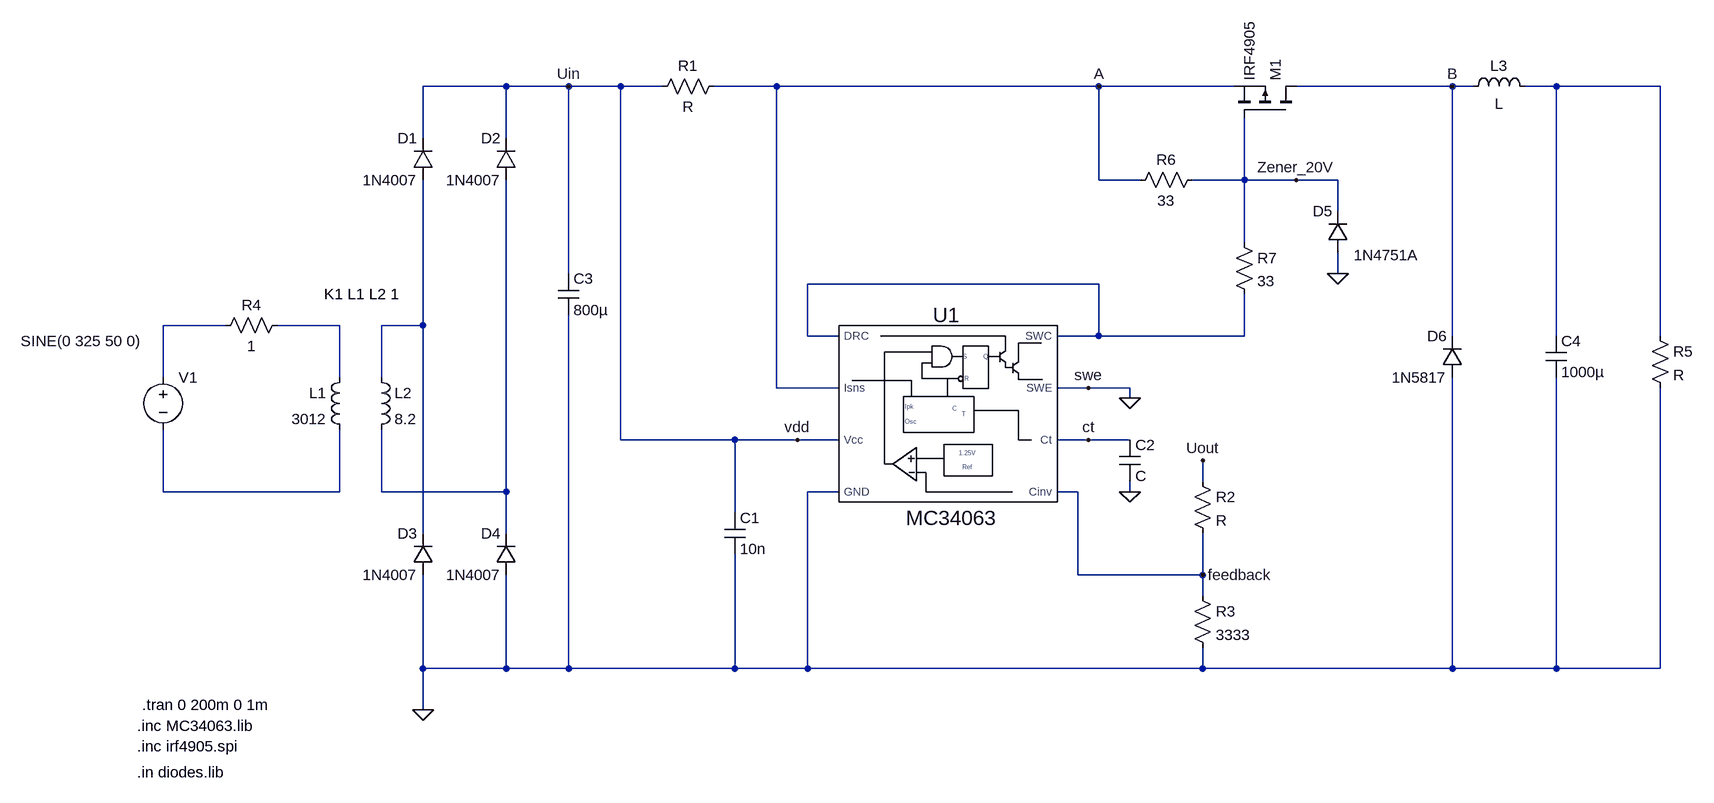
[diagram p0: schematic StepDown_Student.asc]
StepDown_Student.asc, the LTspice schematic file:
Version 4.1
SHEET 1 6568 1292
WIRE -448 -368 -576 -368
WIRE -352 -368 -448 -368
WIRE -272 -368 -352 -368
WIRE -208 -368 -272 -368
WIRE -32 -368 -128 -368
WIRE 464 -368 -32 -368
WIRE 672 -368 464 -368
WIRE 1008 -368 768 -368
WIRE 1040 -368 1008 -368
WIRE 1168 -368 1120 -368
WIRE 1328 -368 1168 -368
WIRE -576 -288 -576 -368
WIRE -448 -288 -448 -368
WIRE 464 -224 464 -368
WIRE 528 -224 464 -224
WIRE 688 -224 688 -320
WIRE 688 -224 608 -224
WIRE 768 -224 688 -224
WIRE 832 -224 768 -224
WIRE 832 -176 832 -224
WIRE 688 -128 688 -224
WIRE -352 -80 -352 -368
WIRE 832 -80 832 -112
WIRE 464 -64 16 -64
WIRE -880 0 -976 0
WIRE -704 0 -800 0
WIRE -576 0 -576 -224
WIRE -576 0 -640 0
WIRE 16 16 16 -64
WIRE 64 16 16 16
WIRE 464 16 464 -64
WIRE 464 16 400 16
WIRE 688 16 688 -48
WIRE 688 16 464 16
WIRE 1008 16 1008 -368
WIRE 1168 16 1168 -368
WIRE 1328 16 1328 -368
WIRE -976 80 -976 0
WIRE -704 80 -704 0
WIRE -640 80 -640 0
WIRE -32 96 -32 -368
WIRE 64 96 -32 96
WIRE 448 96 400 96
WIRE 512 96 448 96
WIRE 512 112 512 96
WIRE -272 176 -272 -368
WIRE -96 176 -272 176
WIRE 0 176 -96 176
WIRE 64 176 0 176
WIRE 448 176 400 176
WIRE 512 176 448 176
WIRE 624 240 624 208
WIRE -976 256 -976 160
WIRE -704 256 -704 160
WIRE -704 256 -976 256
WIRE -640 256 -640 160
WIRE -448 256 -448 -224
WIRE -448 256 -640 256
WIRE 64 256 16 256
WIRE 432 256 400 256
WIRE 512 256 512 240
WIRE -96 288 -96 176
WIRE -576 320 -576 0
WIRE -448 320 -448 256
WIRE 432 384 432 256
WIRE 624 384 624 320
WIRE 624 384 432 384
WIRE 624 416 624 384
WIRE -576 528 -576 384
WIRE -448 528 -448 384
WIRE -448 528 -576 528
WIRE -352 528 -352 -16
WIRE -352 528 -448 528
WIRE -96 528 -96 352
WIRE -96 528 -352 528
WIRE 16 528 16 256
WIRE 16 528 -96 528
WIRE 624 528 624 496
WIRE 624 528 16 528
WIRE 1008 528 1008 80
WIRE 1008 528 624 528
WIRE 1168 528 1168 80
WIRE 1168 528 1008 528
WIRE 1328 528 1328 96
WIRE 1328 528 1168 528
WIRE -576 592 -576 528
FLAG -576 592 0
FLAG 832 -80 0
FLAG 512 112 0
FLAG 512 256 0
FLAG 624 208 Uout
FLAG 624 384 feedback
FLAG -352 -368 Uin
FLAG 448 96 swe
FLAG 448 176 ct
FLAG 464 -368 A
FLAG 1008 -368 B
FLAG 768 -224 Zener_20V
FLAG 0 176 vdd
SYMBOL mc34063 304 112 R0
WINDOW 0 -95 -128 Left 3
WINDOW 3 -137 184 Left 3
SYMATTR InstName U1
SYMBOL pmos 768 -320 M270
SYMATTR InstName M1
SYMATTR Value IRF4905
SYMATTR Prefix X
SYMBOL voltage -976 64 R0
WINDOW 3 -219 -40 Left 2
WINDOW 123 0 0 Left 0
WINDOW 39 0 0 Left 0
SYMATTR InstName V1
SYMATTR Value SINE(0 325 50 0)
SYMBOL ind -688 64 M0
SYMATTR InstName L1
SYMATTR Value 3012
SYMATTR Type ind
SYMATTR SpiceLine Rser=1m
SYMBOL ind -656 64 R0
SYMATTR InstName L2
SYMATTR Value 8.2
SYMATTR Type ind
SYMATTR SpiceLine Rser=1m
SYMBOL res -784 -16 R90
WINDOW 0 0 56 VBottom 2
WINDOW 3 32 56 VTop 2
SYMATTR InstName R4
SYMATTR Value 1
SYMBOL diode -560 -224 R180
WINDOW 0 24 64 Left 2
WINDOW 3 24 0 Left 2
SYMATTR InstName D1
SYMATTR Value 1N4007
SYMBOL diode -432 -224 R180
WINDOW 0 24 64 Left 2
WINDOW 3 24 0 Left 2
SYMATTR InstName D2
SYMATTR Value 1N4007
SYMBOL diode -560 384 R180
WINDOW 0 24 64 Left 2
WINDOW 3 24 0 Left 2
SYMATTR InstName D3
SYMATTR Value 1N4007
SYMBOL diode -432 384 R180
WINDOW 0 24 64 Left 2
WINDOW 3 24 0 Left 2
SYMATTR InstName D4
SYMATTR Value 1N4007
SYMBOL cap -368 -80 R0
SYMATTR InstName C3
SYMATTR Value 800µ
SYMBOL res -112 -384 R90
WINDOW 0 0 56 VBottom 2
WINDOW 3 32 56 VTop 2
SYMATTR InstName R1
SYMBOL cap -112 288 R0
SYMATTR InstName C1
SYMATTR Value 10n
SYMBOL res 624 -240 R90
WINDOW 0 0 56 VBottom 2
WINDOW 3 32 56 VTop 2
SYMATTR InstName R6
SYMATTR Value 33
SYMBOL res 672 -144 R0
SYMATTR InstName R7
SYMATTR Value 33
SYMBOL diode 848 -112 R180
WINDOW 0 24 64 Left 2
WINDOW 3 -109 -4 Left 2
SYMATTR InstName D5
SYMATTR Value 1N4751A
SYMBOL cap 496 176 R0
SYMATTR InstName C2
SYMBOL res 608 224 R0
SYMATTR InstName R2
SYMBOL res 608 400 R0
SYMATTR InstName R3
SYMATTR Value 3333
SYMBOL diode 1024 80 R180
WINDOW 0 24 64 Left 2
WINDOW 3 24 0 Left 2
SYMATTR InstName D6
SYMATTR Value 1N5817
SYMBOL cap 1152 16 R0
SYMATTR InstName C4
SYMATTR Value 1000µ
SYMBOL res 1312 0 R0
SYMATTR InstName R5
SYMBOL ind 1024 -352 R270
WINDOW 0 32 56 VTop 2
WINDOW 3 5 56 VBottom 2
SYMATTR InstName L3
TEXT -1016 616 Left 2 !.inc MC34063.lib
TEXT -1016 648 Left 2 !.inc irf4905.spi
TEXT -728 -48 Left 2 !K1 L1 L2 1
TEXT -1016 688 Left 2 !.in diodes.lib
TEXT -1008 584 Left 2 !.tran 0 200m 0 1m

The netlist it stands for:
* StepDown_Student.asc
X§U1 N002 0 ct 0 feedback vdd A N002 MC34063  ; pins SWC SWE Ct GND Cinv Vcc Isns DRC
X§M1 B Zener_20V A IRF4905  ; pins D G S
V1 N003 N006 SINE(0 325 50 0)
L1 N004 N006 3012 Rser=1m
L2 N005 N007 8.2 Rser=1m
R4 N004 N003 1
D1 N005 vdd 1N4007
D2 N007 vdd 1N4007
D3 0 N005 1N4007
D4 0 N007 1N4007
C3 vdd 0 800µ
R1 A vdd R
C1 vdd 0 10n
R6 Zener_20V A 33
R7 Zener_20V N002 33
D5 0 Zener_20V 1N4751A
C2 ct 0 C
R2 Uout feedback R
R3 feedback 0 3333
D6 0 B 1N5817
C4 N001 0 1000µ
R5 N001 0 R
L3 B N001 L
.model D D
.lib standard.dio
.inc MC34063.lib
.inc irf4905.spi
K1 L1 L2 1
.in diodes.lib
.tran 0 200m 0 1m
.backanno
.end